# Altium schematic sheet Memory_microSD.SchDoc: Memory - microSD Card (SDMMC1)
size A3; ApprovedBy: Weymen Koo; CheckedBy: -; DrawnBy: Weymen Koo; DocumentNumber: UBCAD-FCSOM-SCH; Revision: A; SheetNumber: 12; SheetTotal: 18; ProjectTitle: Flight Controller SoM; Status: PRELIMINARY; ReleaseDate: 2026-11-14
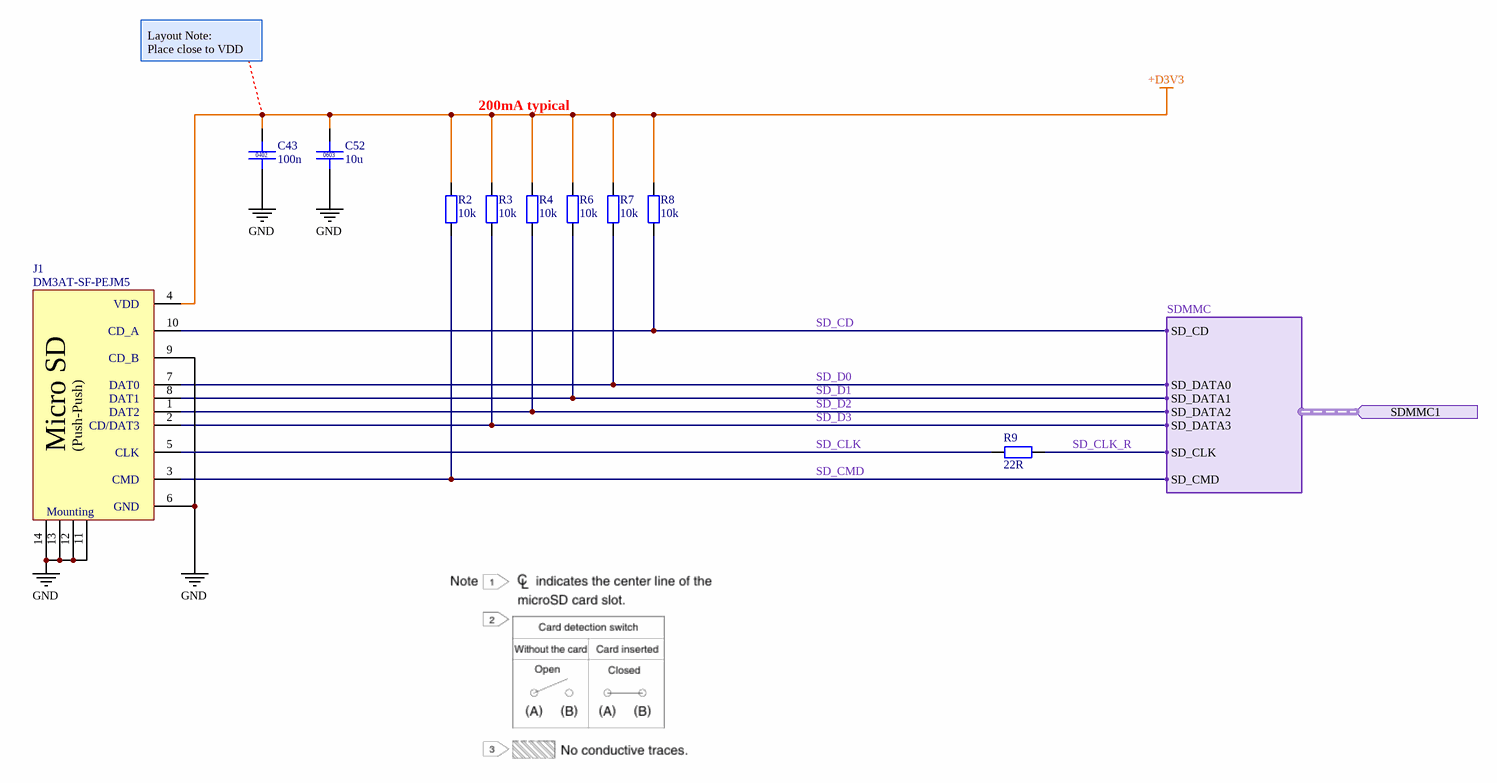
[diagram p0: Memory_microSD.SchDoc]

## Parts
C43  100n  [CAPC1005X05N]
C52  10u  [CAPC1608X08N]
J1  DM3AT-SF-PEJM5  [FP-DM3AT-SF-PEJM5-MFG]
R2  10k  [IPC C R0402 NO SILK]
R3  10k  [IPC C R0402 NO SILK]
R4  10k  [IPC C R0402 NO SILK]
R6  10k  [IPC C R0402 NO SILK]
R7  10k  [IPC C R0402 NO SILK]
R8  10k  [IPC C R0402 NO SILK]
R9  22R  [IPC C R0402 NO SILK]

## Ports
SDMMC1 (in, harness SDMMC, see 1[4B], 4[2D])

## Harnesses
SDMMC: SD_CD, SD_DATA0, SD_DATA1, SD_DATA2, SD_DATA3, SD_CLK, SD_CMD

## Nets
+D3V3: C43.1 C52.1 J1.4(VDD) R2.2 R3.2 R4.2 R6.2 R7.2 R8.2
GND: C43.2 C52.2 J1.6(VSS) J1.9(B) J1.11(MNT_1) J1.12(MNT_2) J1.13(MNT_3) J1.14(MNT_4)
SD_CD: J1.10(A) R8.1 ; port SDMMC1.SD_CD
SD_CLK: J1.5(CLK) R9.1
SD_CLK_R: R9.2 ; port SDMMC1.SD_CLK
SD_CMD: J1.3(CMD) R2.1 ; port SDMMC1.SD_CMD
SD_D0: J1.7(DAT0) R7.1 ; port SDMMC1.SD_DATA0
SD_D1: J1.8(DAT1) R6.1 ; port SDMMC1.SD_DATA1
SD_D2: J1.1(DAT2) R4.1 ; port SDMMC1.SD_DATA2
SD_D3: J1.2(CD/DAT3) R3.1 ; port SDMMC1.SD_DATA3

## Notes on the sheet
- Layout Note:
  Place close to VDD
- 200mA typical
- PROJECT
- KEY
- POWER
- 5 V class
- 3.3 V class
- Core / SMPS
- GND
- SHEET TITLE
- SIGNALS
- NOTES
- SPI
- Analog
- Design
- I2C
- PWM/Timer
- Layout
- UART/RC
- GPIO/Ctrl
- Assembly
- CAN
- Unused pin
- Firmware
- USB/SD/Clk
- Critical
- DRAWN
- DOCUMENT NO.
- CHECKED
- REV
- STATUS
- APPROVED
- DATE
- FILE
- SIZE
- A3
- SHEET
- of
- (in symbol CMP-031-000001-6) CD_A; CD_B; Micro SD; (Push-Push); GND; Mounting

## Library data of the parts
C43 = CMP-002-000094-5: CAP 100n 16V X7R 10% 0402; Manufacturer: Samsung; Manufacturer Part Number: CL05B104KO5NNNC; Value: 100n; Tolerance: 10%; Package: 0402; Voltage: 16V; Dielectric: X7R; LCSC Part #: C1525
C52 = CMP-002-000095-4: CAP 10u 10V X5R 10% 0603; Manufacturer: Samsung; Manufacturer Part Number: CL10A106KP8NNNC; Value: 10u; Tolerance: 10%; Package: 0603; Voltage: 10V; Dielectric: X5R; LCSC Part #: C19702
J1 = CMP-031-000001-6: PCB Connector, 8 Contact(s), 1 Row(s), Male, Right Angle, 0.043 inch Pitch, Surface Mount Terminal, Black Insulator, Receptacle
R2-R4 R6-R8 = CMP-008-000000-2: RES 10k 1% 1/16W 0402; Manufacturer: UNI-ROYAL; Manufacturer Part Number: 0402WGF1002TCE; Value: 10k; Source: Schlib1.SchLib; Design Item ID: Generic RES 0402; Package: 0402; Tolerance: 1%; Power: 1/16W; LCSC Part #: C25744
R9 = CMP-008-000000-2: RES 22R 1% 1/16W 0402; Manufacturer: UNI-ROYAL; Manufacturer Part Number: 0402WGF220JTCE; Value: 22R; Source: Schlib1.SchLib; Design Item ID: Generic RES 0402; Package: 0402; Tolerance: 1%; Power: 1/16W; LCSC Part #: C25092